# Altium schematic sheet BTL.SchDoc
size A4; SheetNumber: 1; SheetTotal: 1
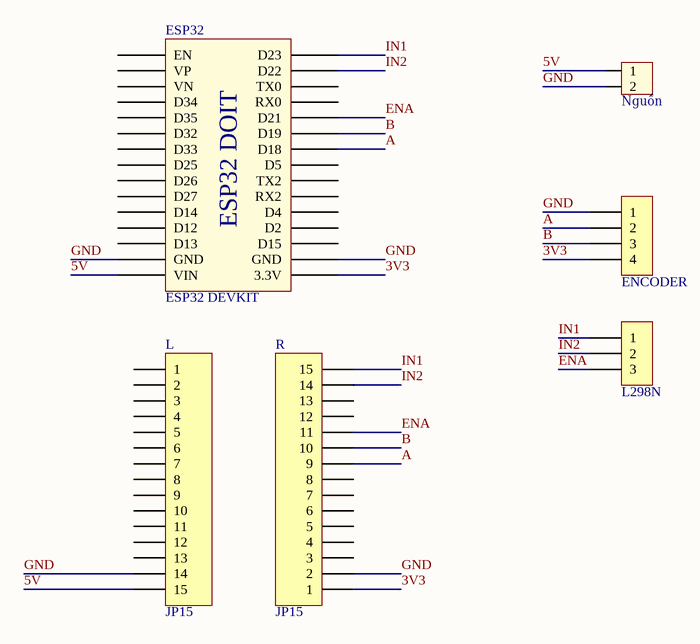
[diagram p0: BTL.SchDoc]

## Parts
ESP32  ESP32 DEVKIT  [ESP32 WROOM 32 KIT]
H5  ENCODER  [XH2.54M-4]
H6  L298N  [XH2.54M-3]
H7  Nguồn  [XH2.54M-2]
L  JP15  [JP15-C1T]
R  JP15  [JP15-C1T]

## Nets
3V3: ESP32.16(3.3V) H5.4 R.1
5V: ESP32.15(VIN) H7.1 L.15
A: ESP32.24(D18) H5.2 R.9
B: ESP32.25(D19) H5.3 R.10
ENA: ESP32.26(D21) H6.3 R.11
GND: ESP32.14(GND) ESP32.17(GND) H5.1 H7.2 L.14 R.2
IN1: ESP32.30(D23) H6.1 R.15
IN2: ESP32.29(D22) H6.2 R.14

Not connected (* = marked no-connect by the designer): ESP32 1(EN) 2(VP) 3(VN) 4(D34) 5(D35) 6(D32) 7(D33) 8(D25) 9(D26) 10(D27) 11(D14) 12(D12) 13(D13) 18(D15) 19(D2) 20(D4) 21(RX2) 22(TX2) 23(D5) 27(RX0) 28(TX0); L 1 2 3 4 5 6 7 8 9 10 11 12 13; R 3 4 5 6 7 8 12 13

## Notes on the sheet
- (in symbol ESP32 WROOM 32 KIT) ESP32 DOIT

## Library data of the parts
ESP32 = ESP32 WROOM 32 KIT
H5 = Header 4P 2.54 Duc Thang: Cắm; Ten_Linh_Kien: Header 4P XH2.54-4P Đực Thẳng; Don_Vi: Con; Ma_Hang: MH001285; Chung_Loai: Cắm
H6 = Header 3P 2.54 Duc Thang: Cắm; Ten_Linh_Kien: Header 3P XH2.54-3P Đực Thẳng; Don_Vi: Con; Ma_Hang: MH001292; Chung_Loai: Cắm
H7 = Header 2P 2.54 Duc Thang: Cắm; Ten_Linh_Kien: Header 2P XH2.54-2P Đực Thẳng; Don_Vi: Con; Ma_Hang: MH001283; Chung_Loai: Cắm
L R = JP15: WR-PHD 2.54 mm Angled Socket Header; Manufacturer: W¨¹rth Elektronik eiSos GmbH; partNo: 613015143121; ComponentLink1 Description: Manufacturer; ComponentLink2 Description: Datasheet; NoPins: 15; Created Date: 29 March 2013; ComponentLink1URL: http://www.we-online.com; ComponentLink2URL: http://katalog.we-online.de/em/datasheet/6130xx143121.pdf; Created by: Karrer Zheng